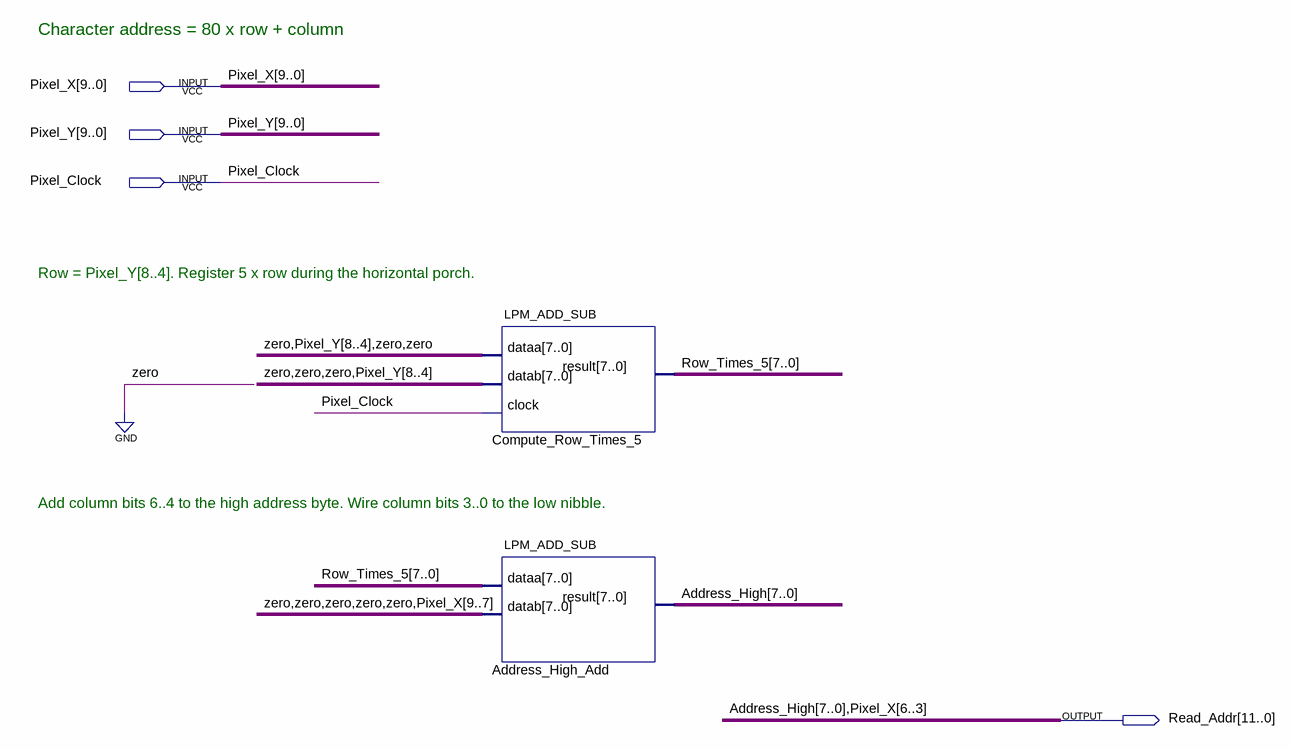
[diagram p0: schematic sheet]
// Quartus schematic Screen_Address.bdf as structural Verilog: 2 symbols, 4 pins
module Screen_Address (
  input  [9:0] Pixel_X,
  input  [9:0] Pixel_Y,
  input  Pixel_Clock,
  output [11:0] Read_Addr
);

  wire [7:0] Row_Times_5;

  LPM_ADD_SUB #(.LPM_WIDTH(8), .LPM_DIRECTION("ADD"), .LPM_REPRESENTATION("UNSIGNED"), .LPM_PIPELINE(1)) Compute_Row_Times_5 (
    .dataa({1'b0, Pixel_Y[8:4], 2'b00}), .datab({3'b000, Pixel_Y[8:4]}), .clock(Pixel_Clock),
    .result(Row_Times_5));
  LPM_ADD_SUB #(.LPM_WIDTH(8), .LPM_DIRECTION("ADD"), .LPM_REPRESENTATION("UNSIGNED"), .LPM_PIPELINE(0)) Address_High_Add (
    .dataa(Row_Times_5), .datab({{5{1'b0}}, Pixel_X[9:7]}), .result(Read_Addr[11:4]));

  assign Read_Addr[3:0] = Pixel_X[6:3];

  // Other names for the same wires on the sheet: Address_High[7:0] = Read_Addr[11:4]

  // Notes on the sheet:
  //   Character address = 80 x row + column
  //   Row = Pixel_Y[8..4]. Register 5 x row during the horizontal porch.
  //   Add column bits 6..4 to the high address byte. Wire column bits 3..0 to the low nibble.
endmodule
